# Altium project Clema Main PCB V1.PrjPcb
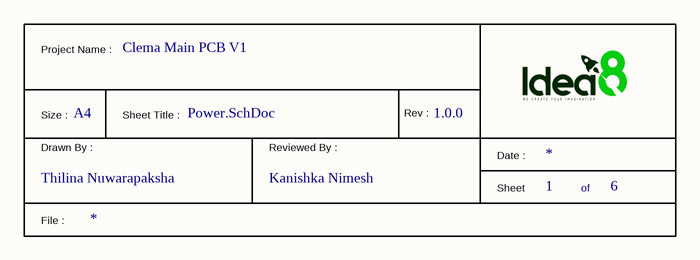
[diagram p0: Power.SchDoc]
Title: Clema Main PCB V1; SheetSize: A4; Revision: 1.0.0; DrawnBy: Thilina Nuwarapaksha; CheckedBy: Kanishka Nimesh
6 sheets, 6 parts. Net scope: global (net labels, ports and power ports of the same name join across sheets).
Sheets:
  Power.SchDoc
  MCU.SchDoc
  Momory.SchDoc
  IMU.SchDoc
  4G module.SchDoc
  RS485.SchDoc

## Sheet Power.SchDoc: Clema Main PCB V1
size A4; SheetNumber: 1; SheetTotal: 6

### Parts
(Parts that share a designator on the sheet are numbered #1, #2 ... from top to bottom, then left to right.)
*#1  TitleBlock1  (value not drawn)  (graphical)

### Notes on the sheet
- (in symbol TitleBlock1) Project Name :; Size :; Sheet Title :; Rev :; Drawn By :; Reviewed By :; Date :; Sheet; of; File :

## Sheet MCU.SchDoc: Clema Main PCB V1
size A3; SheetNumber: 2; SheetTotal: 5
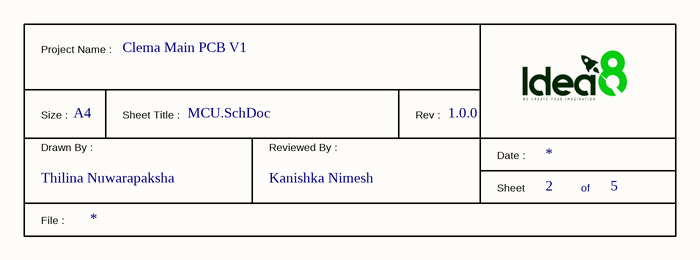
[diagram p1: MCU.SchDoc]

### Parts
(Parts that share a designator on the sheet are numbered #1, #2 ... from top to bottom, then left to right.)
*#2  TitleBlock1  (value not drawn)  (graphical)

### Notes on the sheet
- (in symbol TitleBlock1) Project Name :; Size :; Sheet Title :; Rev :; Drawn By :; Reviewed By :; Date :; Sheet; of; File :

## Sheet Momory.SchDoc: Clema Main PCB V1
size A; SheetNumber: 3; SheetTotal: 5
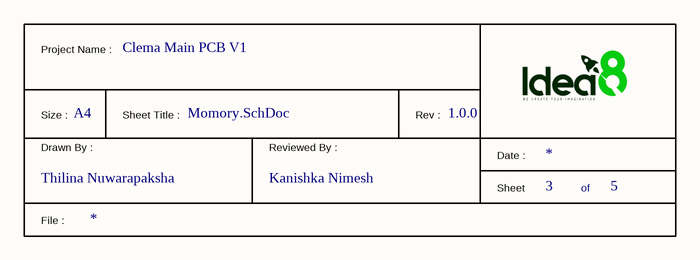
[diagram p2: Momory.SchDoc]

### Parts
(Parts that share a designator on the sheet are numbered #1, #2 ... from top to bottom, then left to right.)
*#3  TitleBlock1  (value not drawn)  (graphical)

### Notes on the sheet
- (in symbol TitleBlock1) Project Name :; Size :; Sheet Title :; Rev :; Drawn By :; Reviewed By :; Date :; Sheet; of; File :

## Sheet IMU.SchDoc: Clema Main PCB V1
size A; SheetNumber: 4; SheetTotal: 5
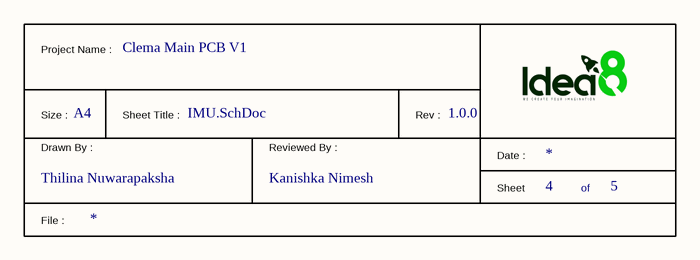
[diagram p3: IMU.SchDoc]

### Parts
(Parts that share a designator on the sheet are numbered #1, #2 ... from top to bottom, then left to right.)
*#4  TitleBlock1  (value not drawn)  (graphical)

### Notes on the sheet
- (in symbol TitleBlock1) Project Name :; Size :; Sheet Title :; Rev :; Drawn By :; Reviewed By :; Date :; Sheet; of; File :

## Sheet 4G module.SchDoc: Clema Main PCB V1
size A; SheetNumber: 6; SheetTotal: 6
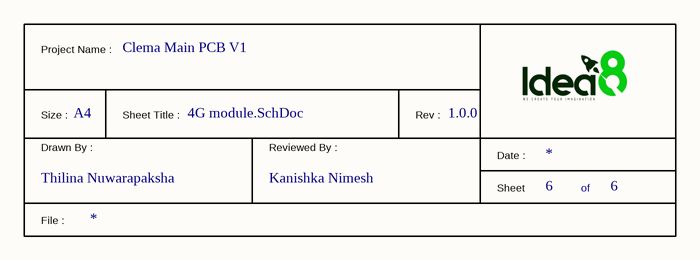
[diagram p4: 4G module.SchDoc]

### Parts
(Parts that share a designator on the sheet are numbered #1, #2 ... from top to bottom, then left to right.)
*#5  TitleBlock1  (value not drawn)  (graphical)

### Notes on the sheet
- (in symbol TitleBlock1) Project Name :; Size :; Sheet Title :; Rev :; Drawn By :; Reviewed By :; Date :; Sheet; of; File :

## Sheet RS485.SchDoc: Clema Main PCB V1
size A; SheetNumber: 6; SheetTotal: 6
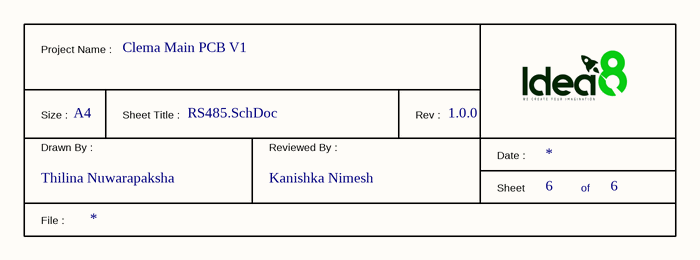
[diagram p5: RS485.SchDoc]

### Parts
(Parts that share a designator on the sheet are numbered #1, #2 ... from top to bottom, then left to right.)
*#6  TitleBlock1  (value not drawn)  (graphical)

### Notes on the sheet
- (in symbol TitleBlock1) Project Name :; Size :; Sheet Title :; Rev :; Drawn By :; Reviewed By :; Date :; Sheet; of; File :